# Altium schematic sheet CPU_PWR - +VCCGT.schdoc
size 420 x 298 mm; Symbol: Sheet-Symbol_A3; Company: 嘉立创EDA; Version: V1.0; Page Size: A3; @Project Name: 【全网首发】X86电脑主板_copy; @Page Count: 35; @Update Date: 2025-10-09; @Create Date: 2025-10-09; @Schematic Name: SCHEMATIC1_1; @Page No: 0; @Page Name: CPU_PWR - +VCCGT; Device: Sheet-Symbol_A3
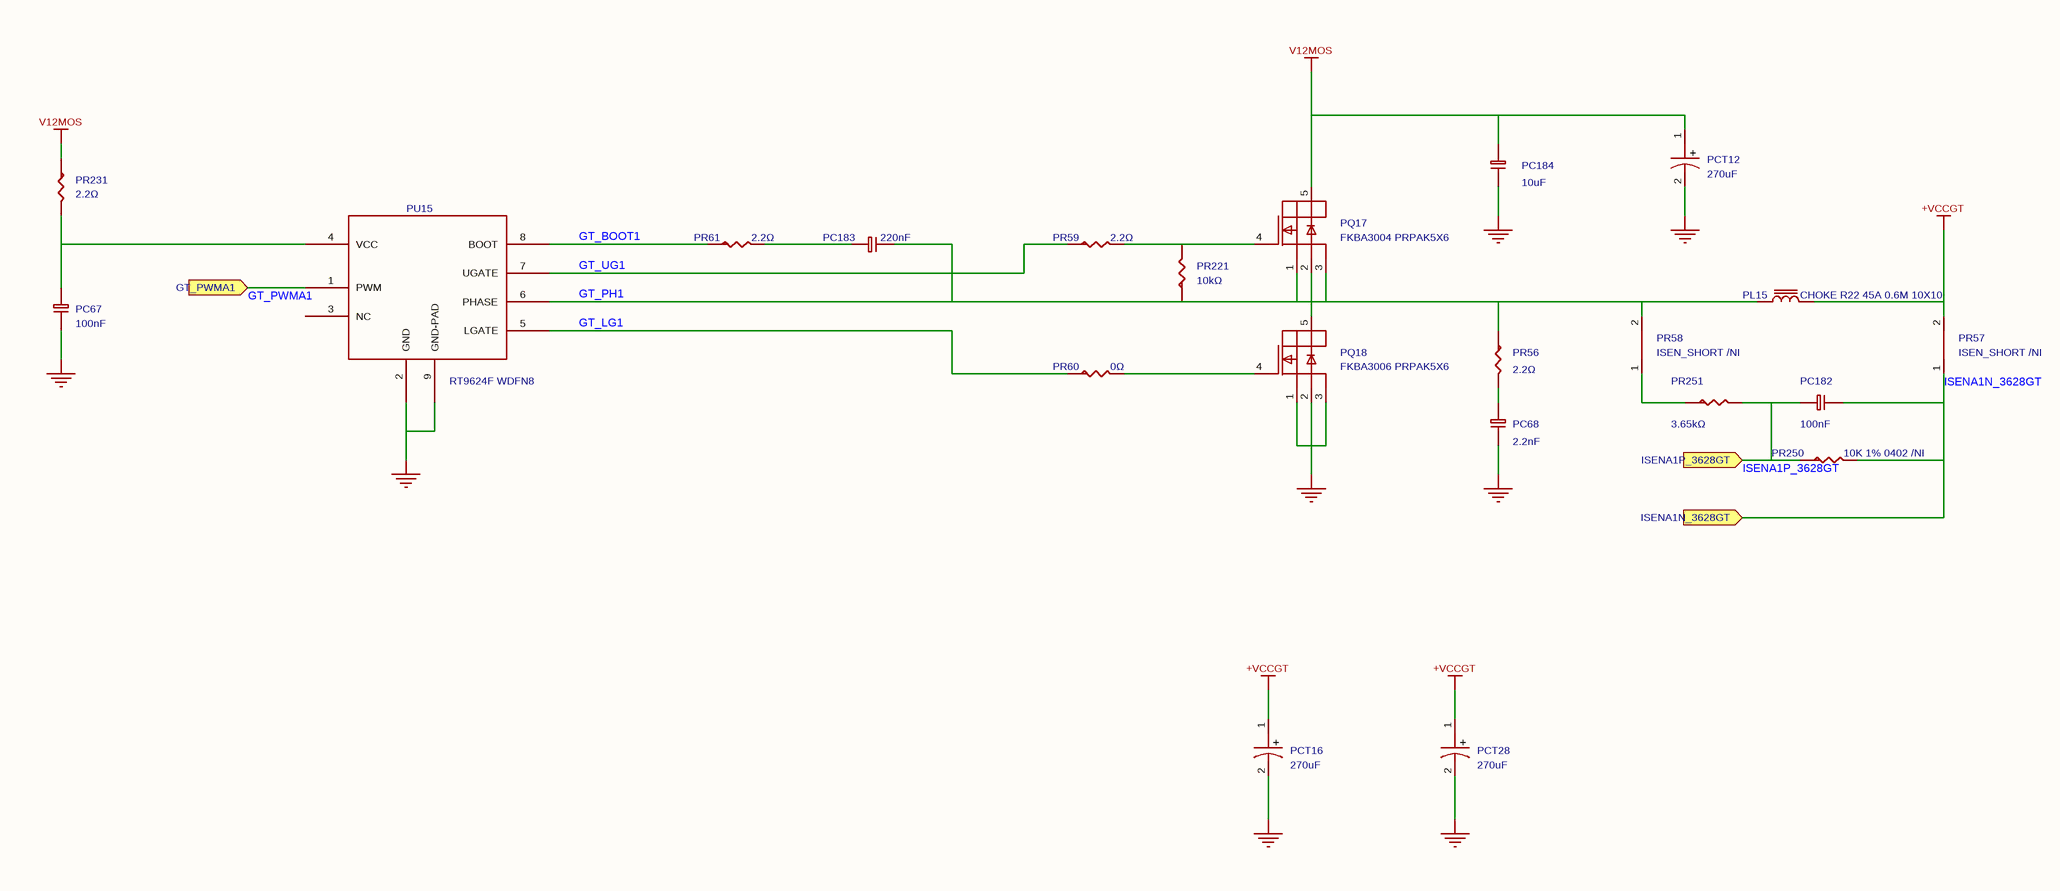
[diagram p0: CPU_PWR - +VCCGT.schdoc]

## Parts
PC67  100nF  [C0402_3]
PC68  2.2nF  [C0402_3]
PC182  100nF  [C0402_1]
PC183  220nF  [C0402_3]
PC184  10uF  [C0805_2]
PCT12  270uF  [EC1P25C_2]
PCT16  270uF  [EC1P25C_2]
PCT28  270uF  [EC1P25C_2]
PL15  value CHOKE R22 45A 0.6M 10X10  [MAGIC R22]  (hidden comment: L_L70-P50-H70)
PQ17  value FKBA3004 PRPAK5X6  [PRPAK5X6_4]  (hidden comment: PK616BA)
PQ18  value FKBA3006 PRPAK5X6  [PRPAK5X6_3]  (hidden comment: PK616BA)
PR56  2.2Ω  [R0603_2]
PR57  value ISEN_SHORT /NI  [ISEN_SHORTNI_1]  (hidden comment: R_0)
PR58  value ISEN_SHORT /NI  [ISEN_SHORTNI_1]  (hidden comment: R_0)
PR59  2.2Ω  [R0603_1]
PR60  0Ω  [R0603_2]
PR61  2.2Ω  [R0603_1]
PR221  10kΩ  [R0402_2]
PR231  2.2Ω  [R0603_1]
PR250  value 10K 1% 0402 /NI  [R0402_2]  (hidden comment: R-0603)
PR251  3.65kΩ  [R0402]
PU15  value RT9624F WDFN8  [DFN8_3X3MM-GND_1]  (hidden comment: RT9624FGQW)

## Ports
GT_PWMA1 (in), ISENA1N_3628GT (in), ISENA1P_3628GT (in)

## Nets
+VCCGT: PCT16.1 PCT28.1 PL15.2 PR57.2
GND: PC67.2 PC68.2 PC184.1 PCT12.2 PCT16.2 PCT28.2 PQ18.1(SOURCE1) PQ18.2(SOURCE2) PQ18.3(SOURCE3) PU15.2(GND) PU15.9(GND-PAD)
V12MOS: PC184.2 PCT12.1 PQ17.5(DRAIN1) PR231.1
GT_BOOT1: PR61.1 PU15.8(BOOT)
GT_LG1: PR60.1 PU15.5(LGATE)
GT_PH1: PC183.2 PL15.1 PQ17.1(SOURCE1) PQ17.2(SOURCE2) PQ17.3(SOURCE3) PQ18.5(DRAIN1) PR56.1 PR58.2 PR221.1 PU15.6(PHASE)
GT_PWMA1: PU15.1(PWM) ; port GT_PWMA1
GT_UG1: PR59.1 PU15.7(UGATE)
ISENA1N_3628GT: PC182.2 PR57.1 PR250.2 ; port ISENA1N_3628GT
ISENA1P_3628GT: PC182.1 PR250.1 PR251.2 ; port ISENA1P_3628GT
NetPC67_1: PC67.1 PR231.2 PU15.4(VCC)
NetPC68_1: PC68.1 PR56.2
NetPC183_1: PC183.1 PR61.2
NetPQ17_4: PQ17.4(GATE) PR59.2 PR221.2
NetPQ18_4: PQ18.4(GATE) PR60.2
NetPR58_1: PR58.1 PR251.1

Not connected (* = marked no-connect by the designer): PU15 3(NC)

## Notes on the sheet
- 更新日期
- 2025-10-09
- 原理图
- 图页
- SCHEMATIC1_1
- CPU_PWR - +VCCGT
- 创建日期
- 物料编码
- 审阅
- 绘制
- 【全网首发】X86电脑主板_copy
- 版本
- V1.0
- 尺寸
- A3
- 页
- 0
- 嘉立创EDA
- 共
- 35
- (in symbol 160AREC271M0609) +

## Library data of the parts
PC67 PC182 = CL05B104KO5NNNC: 容值:100nF;精度:±10%;额定电压:16V;材质(温度系数):X7R;; Manufacturer: SAMSUNG(三星); Symbol: CAP; PCB Footprint: C0402; Tolerance: ±10%; ModelId: 36a51122f27c49738f86b3bfa98863e0; AddInBom: yes; Voltage Rated: 16V; ModelName: C0402_L1.0-W0.5-H0.5; ModelTransform: 39.37,19.685,0,0,0,0,0,0,0; Temperature Coefficient: X7R; Device: CL05B104KO5NNNC; Value: 100nF; Supplier: LCSC; Datasheet: https://atta.szlcsc.com/upload/public/pdf/source/20160103/1457707674891.pdf; SupplierPart: C1525; ConvertToPcb: yes; LCSC Part Name: 100nF ±10% 16V; JLCPCB Part Class: Basic Part; ManufacturerPart: CL05B104KO5NNNC; Supplier Footprint: 0402
  PC67: FootprintName: C0402_3
  PC182: FootprintName: C0402_1
PC68 = CC0402KRX7R9BB222: 容值:2.2nF;精度:±10%;额定电压:50V;材质(温度系数):X7R;; Manufacturer: YAGEO(国巨); Symbol: CAP; PCB Footprint: C0402; Tolerance: ±10%; ModelId: 36a51122f27c49738f86b3bfa98863e0; AddInBom: yes; Voltage Rated: 50V; ModelName: C0402_L1.0-W0.5-H0.5; ModelTransform: 39.37,19.685,0,0,0,0,0,0,0; Temperature Coefficient: X7R; Device: CC0402KRX7R9BB222; Value: 2.2nF; Supplier: LCSC; Datasheet: https://atta.szlcsc.com/upload/public/pdf/source/20170505/1493957848374.pdf; FootprintName: C0402_3; SupplierPart: C106861; ConvertToPcb: yes; LCSC Part Name: 2.2nF ±10% 50V; JLCPCB Part Class: Extended Part; ManufacturerPart: CC0402KRX7R9BB222; Supplier Footprint: 0402
PC183 = CC0402KRX5R7BB224: 容值:220nF;精度:±10%;额定电压:16V;材质(温度系数):X5R;; Manufacturer: YAGEO(国巨); Symbol: CAP; PCB Footprint: C0402; Tolerance: ±10%; ModelId: 36a51122f27c49738f86b3bfa98863e0; AddInBom: yes; Voltage Rated: 16V; ModelName: C0402_L1.0-W0.5-H0.5; ModelTransform: 39.37,19.685,0,0,0,0,0,0,0; Temperature Coefficient: X5R; Device: CC0402KRX5R7BB224; Value: 220nF; Supplier: LCSC; Datasheet: https://atta.szlcsc.com/upload/public/pdf/source/20170728/C106258_1501225689337848724.pdf; FootprintName: C0402_3; SupplierPart: C106258; ConvertToPcb: yes; LCSC Part Name: 220nF ±10% 16V; JLCPCB Part Class: Extended Part; ManufacturerPart: CC0402KRX5R7BB224; Supplier Footprint: 0402
PC184 = CL21A106KOQNNNE: 容值:10uF;精度:±10%;额定电压:16V;材质(温度系数):X5R;; Manufacturer: SAMSUNG(三星); Symbol: CAP NP_31; ModelId: 1ba041120af144c991958decab20d241; Tolerance: ±10%; AddInBom: yes; Voltage Rated: 16V; ModelName: C0805_L2.0-W1.3-H1.3; ModelTransform: 78.74,51.181,0,0,0,0,0,0.0005,0; Temperature Coefficient: X5R; Device: CL21A106KOQNNNE; Value: 10uF; Supplier: LCSC; Datasheet: https://atta.szlcsc.com/upload/public/pdf/source/20160103/1457707694240.pdf; FootprintName: C0805_2; SupplierPart: C1713; ConvertToPcb: yes; LCSC Part Name: 10uF ±10% 16V; JLCPCB Part Class: Extended Part; ManufacturerPart: CL21A106KOQNNNE; Supplier Footprint: 0805
PCT12 PCT16 PCT28 = 160AREC271M0609: 容值:270uF;精度:±20%;额定电压:16V;纹波电流:3.8A@100kHz;等效串联电阻:15mΩ@100kHz~300kHz;类型:-;; Manufacturer: APAQ(钰邦); Symbol: CAPACITOR POL_0; AddInBom: yes; ModelId: 0a4db4bf24b443b3be4905be97ff10c5; ModelName: CAP-TH_BD6.3-P2.50-D1.0-FD; ModelTransform: 248.4247,247.99777,0,0,0,0,0,0,-137.795; Tolerance: ±20%; Rated Voltage: 16V; φD: 6.3mm; L: 9mm; Lifetime @ Temp: 2000hrs@105℃; Device: 160AREC271M0609; Value: 270uF; LCSC Part Name: 270uF ±20% 16V; SupplierPart: C176312; ManufacturerPart: 160AREC271M0609; Supplier Footprint: 插件,D6.3xL9mm; JLCPCB Part Class: Extended Part; Datasheet: https://atta.szlcsc.com/upload/public/pdf/source/20180420/C176312_A6CC051F3F5535015096354530D22B11.pdf; Supplier: LCSC; ConvertToPcb: yes; FootprintName: EC1P25C_2; Ripple Current: 3.8A@100kHz; Equivalent Series Resistance(ESR): 15mΩ@100kHz~300kHz; Type: -; Lead Spacing: 2.5mm; Operating Temperature: -55℃~+105℃
PL15 = L_L70-P50-H70_3: Check: false; AddInBom: yes; Device: L_L70-P50-H70_3; Symbol: L_L70-P50-H70; FootprintName: MAGIC R22; ConvertToPcb: yes
PQ17 PQ18 = PK616BA: 类型:1个N沟道;漏源电压(Vdss):30V;连续漏极电流(Id):50A;功率(Pd):31W;导通电阻(RDS(on)@Vgs,Id):9.5mΩ@4.5V,13A;阈值电压(Vgs(th)@Id):3V@250uA;; Manufacturer: NIKO-SEM(尼克森); Symbol: MOS-N_SO8_1; AddInBom: yes; ModelId: 178189b27e7544aca50c111426555358; ModelName: PDFN-8_L4.9-W5.8-H1.0-P1.27; ModelTransform: 200.787,240.157,0,0,0,0,-0.097,0,0; Drain Source Voltage (Vdss): 30V; Continuous Drain Current (Id): 50A; Power Dissipation (Pd): 31W; Device: PK616BA; LCSC Part Name: 1个N沟道 耐压:30V 电流:50A; SupplierPart: C133608; ManufacturerPart: PK616BA; Supplier Footprint: PDFN-8(5.8x4.9); JLCPCB Part Class: Extended Part; Datasheet: https://atta.szlcsc.com/upload/public/pdf/source/20170930/C133608_1506736454344997453.pdf; Supplier: LCSC; ConvertToPcb: yes; Type: 1个N沟道; Drain Source On Resistance (RDS(on)@Vgs,Id): 9.5mΩ@4.5V,13A; Gate Threshold Voltage (Vgs(th)@Id): 3V@250uA
  PQ17: FootprintName: PRPAK5X6_4
  PQ18: FootprintName: PRPAK5X6_3
PR56 PR59 PR61 PR231 = 0603WAF220KT5E: 电阻类型:厚膜电阻;阻值:2.2Ω;精度:±1%;功率:100mW;; Manufacturer: UNI-ROYAL(厚声); Symbol: R_1; ModelId: fc143cca1e79419f9cd78b61e9279f08; Tolerance: ±1%; AddInBom: yes; Power(Watts): 100mW; ModelName: R0603; ModelTransform: 31.8897,63.7794,0,90,0,0,0,0,0; Overload Voltage (Max): 75V; Temperature Coefficient: ±400ppm/℃; Device: 0603WAF220KT5E; Value: 2.2Ω; Type: 厚膜电阻; Supplier: LCSC; Datasheet: https://atta.szlcsc.com/upload/public/pdf/source/20200306/C422600_1E6D84923E4A46A82E41ADD87F860B5C.pdf; SupplierPart: C22939; ConvertToPcb: yes; LCSC Part Name: 2.2Ω ±1% 100mW; JLCPCB Part Class: Basic Part; ManufacturerPart: 0603WAF220KT5E; Supplier Footprint: 0603; Operating Temperature Range: -55℃~+155℃
  PR56: FootprintName: R0603_2
  PR59 PR61 PR231: FootprintName: R0603_1
PR57 PR58 = R_1: Check: false; AddInBom: yes; Device: R_1; Symbol: R_0; FootprintName: ISEN_SHORTNI_1; ConvertToPcb: yes
PR60 = 0603WAF0000T5E: 电阻类型:厚膜电阻;阻值:0Ω;精度:±1%;功率:100mW;; Manufacturer: UNI-ROYAL(厚声); Symbol: R_1; ModelId: fc143cca1e79419f9cd78b61e9279f08; Tolerance: ±1%; AddInBom: yes; Power(Watts): 100mW; ModelName: R0603; ModelTransform: 31.8897,63.7794,0,90,0,0,0,0,0; Overload Voltage (Max): 75V; Device: 0603WAF0000T5E; Value: 0Ω; Type: 厚膜电阻; Supplier: LCSC; Datasheet: https://atta.szlcsc.com/upload/public/pdf/source/20200306/C422600_1E6D84923E4A46A82E41ADD87F860B5C.pdf; FootprintName: R0603_2; SupplierPart: C21189; ConvertToPcb: yes; LCSC Part Name: 0Ω ±1% 100mW; JLCPCB Part Class: Basic Part; ManufacturerPart: 0603WAF0000T5E; Supplier Footprint: 0603; Operating Temperature Range: -55℃~+155℃
PR221 = 0402WGF1002TCE: 电阻类型:厚膜电阻;阻值:10kΩ;精度:±1%;功率:62.5mW;; Manufacturer: UNI-ROYAL(厚声); Symbol: R-0603; ModelId: 671aefced39d4c318694bba8bd8efd39; Tolerance: ±1%; AddInBom: yes; Power(Watts): 62.5mW; ModelName: R0402_L1.0-W0.5-H0.5; ModelTransform: 39.37,19.685,0,0,0,0,0,0.0005,0; Overload Voltage (Max): 50V; Temperature Coefficient: ±100ppm/℃; Device: 0402WGF1002TCE; Value: 10kΩ; Type: 厚膜电阻; Supplier: LCSC; Datasheet: https://atta.szlcsc.com/upload/public/pdf/source/20200306/C422600_1E6D84923E4A46A82E41ADD87F860B5C.pdf; FootprintName: R0402_2; SupplierPart: C25744; ConvertToPcb: yes; LCSC Part Name: 10kΩ ±1% 62.5mW; JLCPCB Part Class: Basic Part; ManufacturerPart: 0402WGF1002TCE; Supplier Footprint: 0402; Operating Temperature Range: -55℃~+155℃
PR250 = R-0603_2: Manufacturer: YAGEO(国巨); Manufacturer Part: RC0402FR-0710KL; 3D Model: 671aefced39d4c318694bba8bd8efd39; 3D Model Transform: 39.37,19.685,0,0,0,0,0,0.0005,0; Tolerance: ±1%; Power(Watts): 62.5mW; Overload Voltage (Max): 50V; Temperature Coefficient: ±100ppm/℃; AddInBom: yes; Device: R-0603_2; Symbol: R-0603; LCSC Part Name: 厚膜电阻 10kΩ ±1% 62.5mW; Supplier Part: C60490; Supplier Footprint: 0402; JLCPCB Part Class: Extended Part; Datasheet: https://atta.szlcsc.com/upload/public/pdf/source/20170925/C131467_1506321478108990263.pdf; Supplier: LCSC; Type: 厚膜电阻; Operating Temperature Range: -55℃~+155℃; FootprintName: R0402_2; ConvertToPcb: yes
PR251 = ERJ2RKF3651X: 电阻类型:厚膜电阻;阻值:3.65kΩ;精度:±1%;功率:100mW;最大工作电压:100V;温度系数:±100ppm/℃;; Manufacturer: PANASONIC(松下); Symbol: R-0603; AddInBom: yes; ModelId: 671aefced39d4c318694bba8bd8efd39; ModelName: R0402_L1.0-W0.5-H0.5; ModelTransform: 39.37,19.685,0,0,0,0,0,0.0005,0; Tolerance: ±1%; Power(Watts): 100mW; Overload Voltage (Max): 100V; Device: ERJ2RKF3651X; Value: 3.65kΩ; LCSC Part Name: 3.65kΩ ±1% 100mW 厚膜电阻; SupplierPart: C416527; ManufacturerPart: ERJ2RKF3651X; Supplier Footprint: 0402; JLCPCB Part Class: Extended Part; Datasheet: https://atta.szlcsc.com/upload/public/pdf/source/20190902/C416527_C4564A8D72F3E2A9CDC3D7769B95121D.pdf; Supplier: LCSC; ConvertToPcb: yes; FootprintName: R0402; Type: 厚膜电阻; Temperature Coefficient: ±100ppm/℃; Operating Temperature Range: -55℃~+155℃
PU15 = RT9624FGQW: Manufacturer: RICHTEK(立锜); Symbol: RT9624F_1; AddInBom: yes; ModelId: 87cbd0851a6d45bba9a717edfc43b2c9; ModelName: TDFN-8_L3.0-W3.0-P0.65-BL-EP2.3; ModelTransform: 118.11,118.8974,0,0,0,0,0,0,0; Device: RT9624FGQW; LCSC Part Name: Single Phase Synchronous Rectified Buck MOSFET Driver; SupplierPart: C3020454; ManufacturerPart: RT9624FGQW; Supplier Footprint: TDFN-8-EP(3x3); JLCPCB Part Class: Extended Part; Datasheet: https://atta.szlcsc.com/upload/public/pdf/source/20220608/64F557171D909C63F38446B0F2BC2FB2.pdf; Supplier: LCSC; ConvertToPcb: yes; FootprintName: DFN8_3X3MM-GND_1